# Altium schematic sheet pca10123-sheet3_misc.SchDoc: =BoardTitle
size A3; Organization: Nordic Semiconductor; DocumentNumber: 3; SheetNumber: 3; SheetTotal: 3; CompanyName: Nordic Semiconductor; DocumentSize: A3; Project Number: 4477
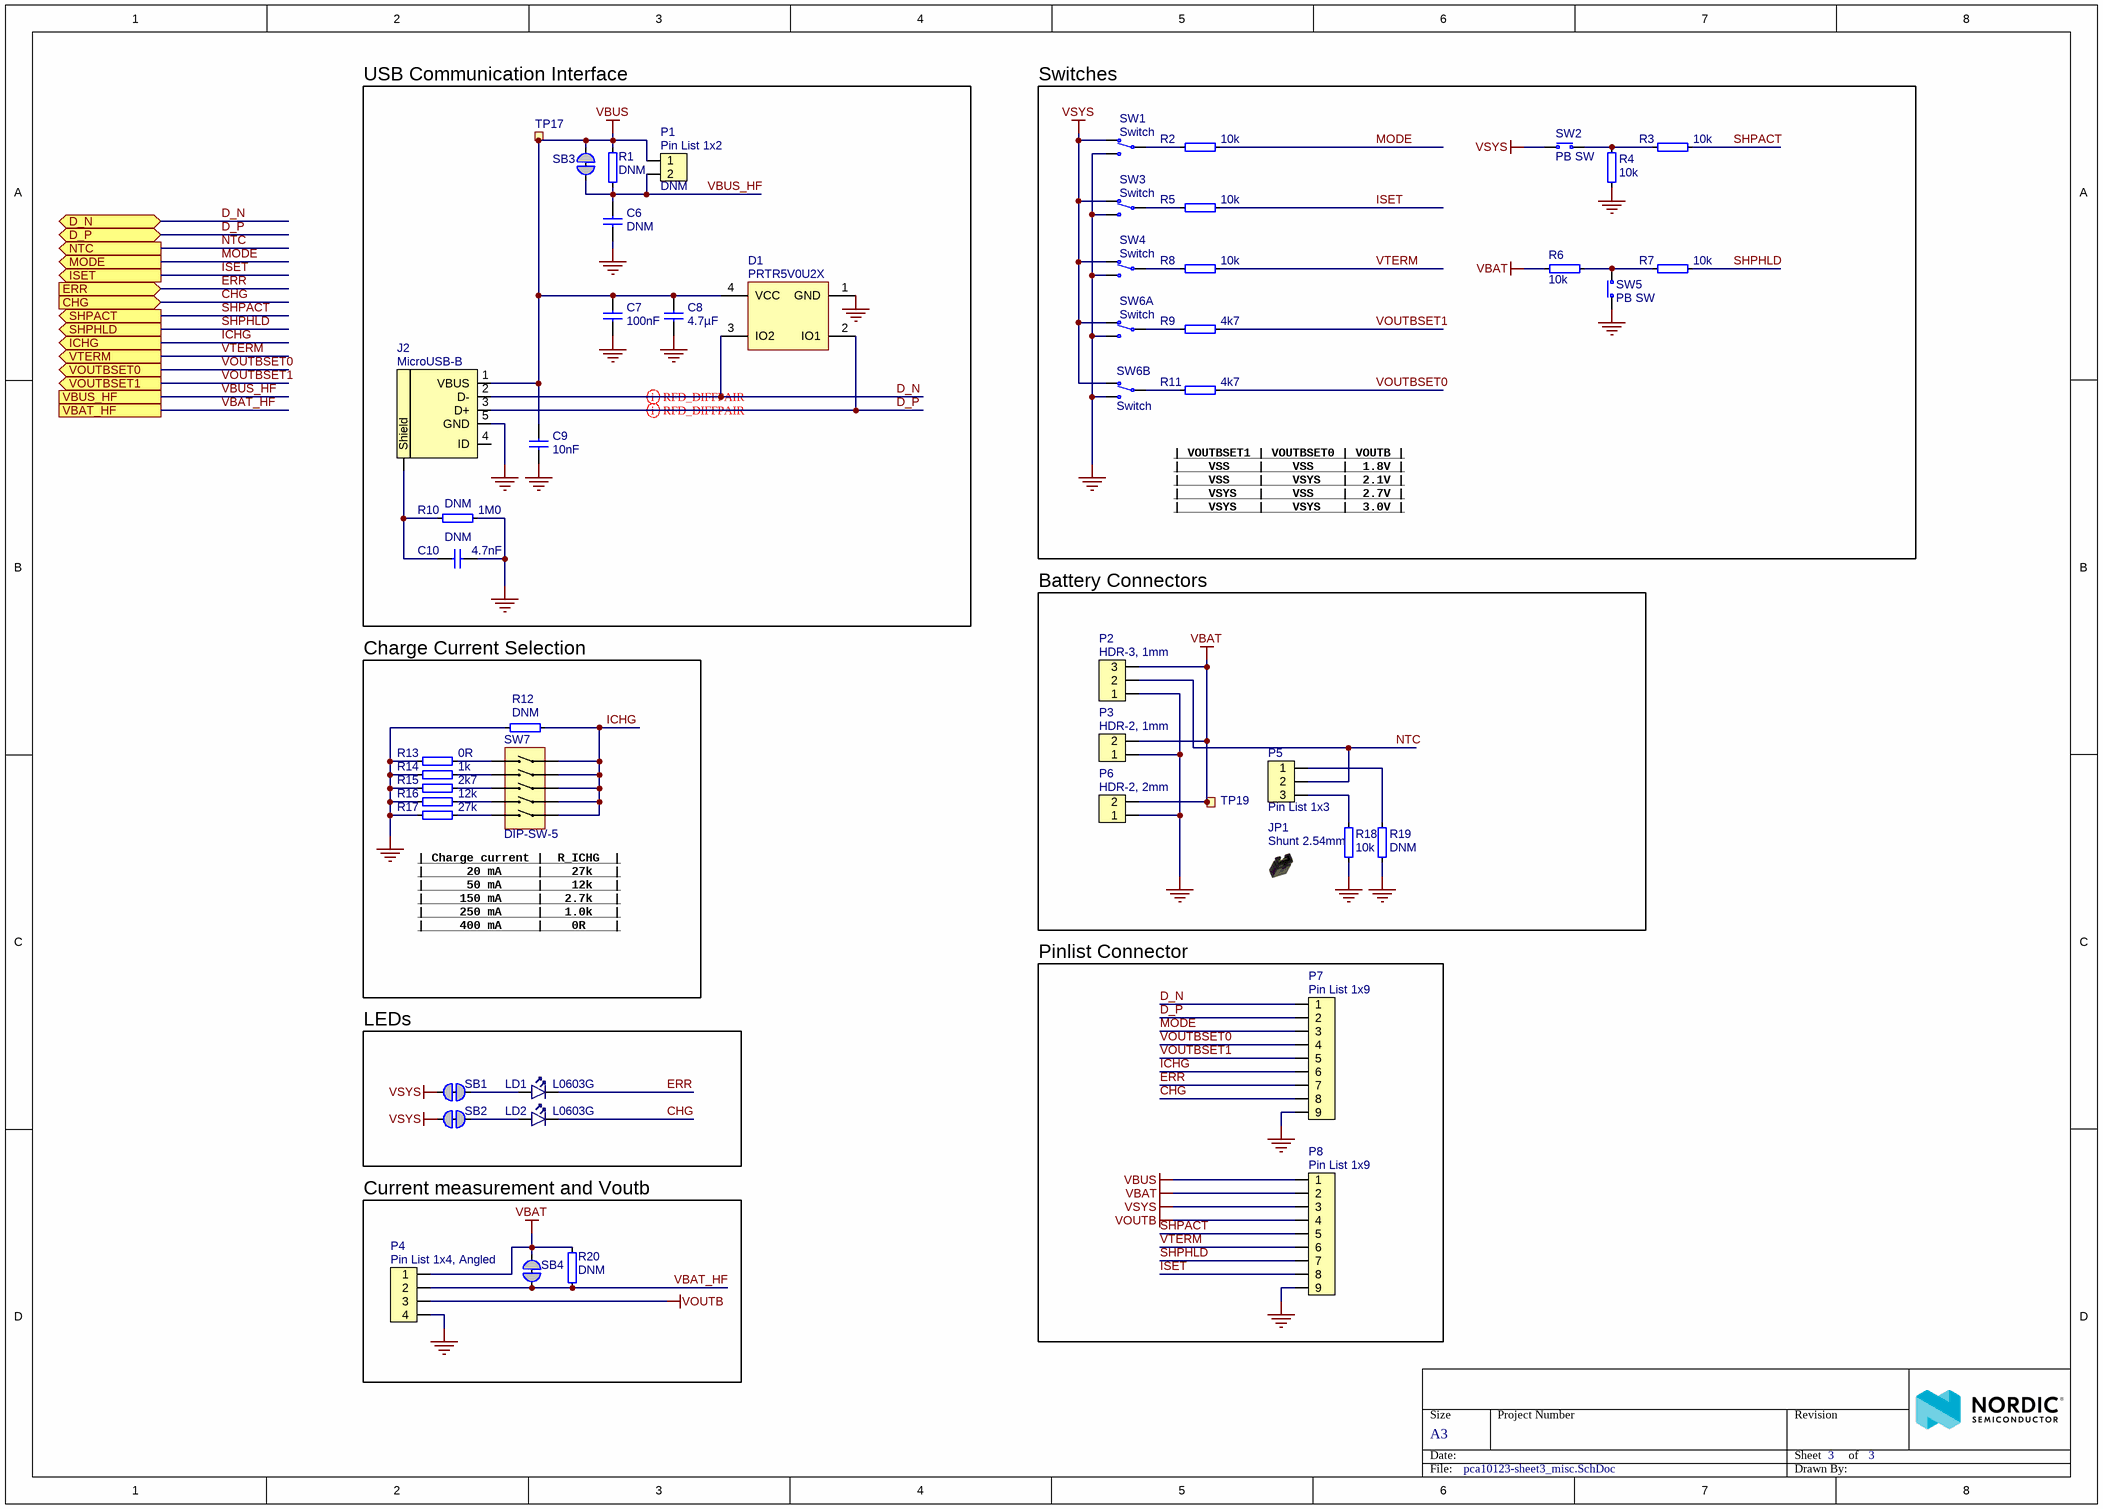
[diagram p0: pca10123-sheet3_misc.SchDoc]

## Parts
C6  DNM  [CAPC2012X11L_NC]
C7  100nF  [CAPC0603X03L_C]
C8  4.7µF  [CAPC1005X04L]
C9  10nF  [CAPC0603X03L_C]
C10  4.7nF  Assembly: DNM  [CAPC0603X03L_C]
D1  PRTR5V0U2X  [SOT190P230X110-4L]
J2  MicroUSB-B  [USB-Micro-B-RA-SMD-PiP]
JP1  Shunt 2.54mm  [Shunt_2.54mm]
LD1  L0603G  [LED_0603_R]
LD2  L0603G  [LED_0603_G]
P1  Pin List 1x2  Assembly: DNM  [LIST_1x2]
P2  HDR-3, 1mm  [SM03B-SRSS-TB]
P3  HDR-2, 1mm  [SM02B-SRSS-TB]
P4  Pin List 1x4, Angled  [LIST_ANG_1x4-SMD-2.54MM]
P5  Pin List 1x3  [LIST_1x3_SMD]
P6  HDR-2, 2mm  [S2B-PH-SM4-TB]
P7  Pin List 1x9  [LIST_1x9_SMD]
P8  Pin List 1x9  [LIST_1x9_SMD]
R1  DNM  [RESC1005X04L_NC]
R2  10k  [RESC1005X04L]
R3  10k  [RESC1005X04L]
R4  10k  [RESC1005X04L]
R5  10k  [RESC1005X04L]
R6  10k  [RESC1005X04L]
R7  10k  [RESC1005X04L]
R8  10k  [RESC1005X04L]
R9  4k7  [RESC1005X04L]
R10  1M0  Assembly: DNM  [RESC0603X03L_C]
R11  4k7  [RESC1005X04L]
R12  DNM  [RESC1005X04L_NC]
R13  0R  [RESC1005X04L]
R14  1k  [RESC1005X04L]
R15  2k7  [RESC1005X04L]
R16  12k  [RESC1005X04L]
R17  27k  [RESC1005X04L]
R18  10k  [RESC1005X04L]
R19  DNM  [RESC1608X06L_NC]
R20  DNM  [RESC1005X04L_NC]
SB1  Solderbridge  [Solderbridge_Shorted]  (value not drawn)  (net tie, no BOM)
SB2  Solderbridge  [Solderbridge_Shorted]  (value not drawn)  (net tie, no BOM)
SB3  Solderbridge  [Solderbridge_Shorted_Power]  (value not drawn)  (net tie, no BOM)
SB4  Solderbridge  [Solderbridge_Shorted_Power]  (value not drawn)  (net tie, no BOM)
SW1  Switch  [CJS-120xA]
SW2  PB SW  [C&K_PTS810]
SW3  Switch  [CJS-120xA]
SW4  Switch  [CJS-120xA]
SW5  PB SW  [C&K_PTS810]
SW6  Switch  [CAS-D20A]  (parts A,B of 2)
SW7  DIP-SW-5  [SOIC127P840X265-10N]
TP17  Ø1.5mm,SMD  [TP_SMD_D1.5mm]  (value not drawn)  (no BOM)
TP19  Ø1.5mm,SMD  [TP_SMD_D1.5mm]  (value not drawn)  (no BOM)

## Blocks framed on the sheet
USB Communication Interface: C6-C10 D1 J2 P1 R1 R10 SB3 TP17
Switches: R2-R9 R11 SW1-SW6
Battery Connectors: JP1 P2 P3 P5 P6 R18 R19 TP19
Charge Current Selection: R12-R17 SW7
Pinlist Connector: P7 P8
LEDs: LD1 LD2 SB1 SB2
Current measurement and Voutb: P4 R20 SB4

## Ports
CHG (in), D_N (bidir), D_P (bidir), ERR (in), ICHG (out), ISET (out), MODE (out), NTC (out), SHPACT (out), SHPHLD (out), VBAT_HF, VBUS_HF, VOUTBSET0 (out), VOUTBSET1 (out), VTERM (out)

## Nets
GND: C6.1 C7.2 C8.2 C9.2 C10.2 D1.1(GND) J2.5(GND) P2.1 P3.1 P4.4 P6.1 P7.9 P8.9 R4.2 R10.2 R12.1 R13.1 R14.1 R15.1 R16.1 R17.1 R18.1 R19.1 SW1.3(N.O) SW3.3(N.O) SW4.3(N.O) SW5.2(COM) SW6.1(N.O) SW6.4(N.O)
VBAT: P2.3 P3.2 P4.1 P6.2 P8.2 R6.2 R20.2 SB4.2 TP19.1
VBUS: C7.1 C8.1 C9.1 D1.4(VCC) J2.1(VBUS) P1.1 P8.1 R1.2 SB3.1 TP17.1
VOUTB: P4.3 P8.4
VSYS: P8.3 SB1.1 SB2.1 SW1.1(N.C) SW2.2(COM) SW3.1(N.C) SW4.1(N.C) SW6.3(N.C) SW6.6(N.C)
CHG: LD2.1(C) P7.8 ; port CHG
D_N: D1.3(IO2) J2.2(D-) P7.1 ; port D_N
D_P: D1.2(IO1) J2.3(D+) P7.2 ; port D_P
ERR: LD1.1(C) P7.7 ; port ERR
ICHG: P7.6 R12.2 SW7.6 SW7.7 SW7.8 SW7.9 SW7.10 ; port ICHG
ISET: P8.8 R5.2 ; port ISET
MODE: P7.3 R2.2 ; port MODE
NTC: P2.2 P5.2 ; port NTC
SHPACT: P8.5 R3.2 ; port SHPACT
SHPHLD: P8.7 R7.2 ; port SHPHLD
VBAT_HF: P4.2 R20.1 SB4.1 ; port VBAT_HF
VBUS_HF: C6.2 P1.2 R1.1 SB3.2 ; port VBUS_HF
VOUTBSET0: P7.4 R11.2 ; port VOUTBSET0
VOUTBSET1: P7.5 R9.2 ; port VOUTBSET1
VTERM: P8.6 R8.2 ; port VTERM
NetC10_1: C10.1 J2.6(Shield) R10.1
NetLD1_2: LD1.2(A) SB1.2
NetLD2_2: LD2.2(A) SB2.2
NetP5_1: P5.1 R19.2
NetP5_3: P5.3 R18.2
NetR2_1: R2.1 SW1.2(COM)
NetR3_1: R3.1 R4.1 SW2.1(N.O)
NetR5_1: R5.1 SW3.2(COM)
NetR6_1: R6.1 R7.1 SW5.1(N.O)
NetR8_1: R8.1 SW4.2(COM)
NetR9_1: R9.1 SW6.2(COM)
NetR11_1: R11.1 SW6.5(COM)
NetR13_2: R13.2 SW7.1
NetR14_2: R14.2 SW7.2
NetR15_2: R15.2 SW7.3
NetR16_2: R16.2 SW7.4
NetR17_2: R17.2 SW7.5

Not connected (* = marked no-connect by the designer): J2 4(ID)

## Layout directives
differential pair; differential pair class USB2: D_N, D_P

## Notes on the sheet
- | VOUTBSET1 | VOUTBSET0 | VOUTB |
  |    VSS    |    VSS    |  1.8V |
  |    VSS    |    VSYS   |  2.1V |
  |    VSYS   |    VSS    |  2.7V |
  |    VSYS   |    VSYS   |  3.0V |
- | Charge current |  R_ICHG  |
  |      20 mA     |    27k   |
  |      50 mA     |    12k   |
  |     150 mA     |   2.7k   |
  |     250 mA     |   1.0k   |
  |     400 mA     |    0R    |
- Size
- Date:
- A3
- Project Number
- Sheet         of
- Revision
- File:
- Drawn By:

## Library data of the parts
C6 = C0805-N.C.: Not mounted; Manufacturer: N.A.; Assembly: Not mounted; Note: Chip Cap; Pad Count: 2; Part Number: C0805-N.C.; Manufacturer Part Number: N.A.; ComponentLink1URL: N.A.; ComponentLink1Description: Datasheet; ComponentLink2URL: N.A.; ComponentLink2Description: Supplier link; HelpURL: N.A.; Footprint Doc: 0805; LatestRevisionDate: 2013-06-04; Publisher: Nordic Semiconductor; Published: 2009-05-08; Value: DNM; Supplier 1: N.A.; Supplier Part Number 1: N.A.; Supplier 2: N.A.; Supplier Part Number 2: N.A.; Artikkelnr Noca: N.A.; Part number IPS: N.A.; Component Class: Capacitors; PartId: 100200278; Author: rsk; Part number Norautron: N.A.
C7 = C0201-100n: Capacitor, X5R, ±10%; Manufacturer: N.A.; Part number IPS: 00000001248, 00000002505; Note: 16V; Pad Count: 2; Part Number: C0201-100n; Manufacturer Part Number: N.A.; ComponentLink1URL: N.A.; ComponentLink1Description: Datasheet; ComponentLink2URL: N.A.; ComponentLink2Description: Supplier link; HelpURL: N.A.; Footprint Doc: 0201; LatestRevisionDate: 2017-11-09; Publisher: Nordic Semiconductor; Published: 2014-11-13; Value: 100nF; Supplier 1: N.A.; Supplier Part Number 1: N.A.; Supplier 2: N.A.; Supplier Part Number 2: N.A.; Artikkelnr Noca: N.A.; Component Class: Capacitors; PartId: 100200078; Author: rsk; Part number Norautron: N.A.
C8 = C0402-4µ7: Capacitor, X5R, ±20%; Manufacturer: N.A.; Part number IPS: 00000001251, 00000007165; Note: 10V; Artikkelnr Noca: 20039482; Pad Count: 2; Part Number: C0402-4µ7; Manufacturer Part Number: N.A.; LatestRevisionDate: 2017-11-09; Publisher: Nordic Semiconductor; Published: 2009-05-08; Value: 4.7µF; Footprint Doc: 0402; ComponentLink1URL: N.A.; ComponentLink1Description: Datasheet; ComponentLink2URL: N.A.; ComponentLink2Description: Supplier link; HelpURL: N.A.; Supplier 1: Digi-Key; Supplier Part Number 1: 490-13252-1-ND; Supplier 2: N.A.; Supplier Part Number 2: N.A.; Component Class: Capacitors; PartId: 100200193; Author: rsk; Part number Norautron: N.A.
C9 = C0201-10n: Capacitor, X7R, ±10%; Manufacturer: N.A.; Part number IPS: 00000003480; Note: 10V; Pad Count: 2; Part Number: C0201-10n; Manufacturer Part Number: N.A.; LatestRevisionDate: 2017-11-09; Publisher: Nordic Semiconductor; Published: 2014-11-13; Value: 10nF; Artikkelnr Noca: N.A.; ComponentLink1URL: N.A.; ComponentLink1Description: Datasheet; ComponentLink2URL: N.A.; ComponentLink2Description: Supplier link; HelpURL: N.A.; Footprint Doc: 0201; Supplier 1: N.A.; Supplier Part Number 1: N.A.; Supplier 2: N.A.; Supplier Part Number 2: N.A.; Component Class: Capacitors; PartId: 100200067; Author: rsk; Part number Norautron: N.A.
C10 = C0201-4n7: Chip Cap 0201 4.7nF 10% 10V X7R; Manufacturer: N.A.; Part number IPS: 00000001243; Note: Chip Cap 1%; Pad Count: 2; Part Number: C0201-4n7; Manufacturer Part Number: N.A.; LatestRevisionDate: 2020-10-13; Publisher: Nordic Semiconductor; Published: 2014-11-13; Value: 4.7nF; Artikkelnr Noca: N.A.; Footprint Doc: 0201; ComponentLink1URL: N.A.; ComponentLink1Description: Datasheet; ComponentLink2URL: N.A.; ComponentLink2Description: Supplier link; HelpURL: N.A.; Supplier 1: N.A.; Supplier Part Number 1: N.A.; Supplier 2: N.A.; Supplier Part Number 2: N.A.; Component Class: Capacitors; PartId: 100200063; Author: rsk; Part number Norautron: N.A.
D1 = PRTR5V0U2X: Ultra low capacitance double rail-to-rail ESD protection diode; Manufacturer: NXP Semiconductors; Part number IPS: 00000009951; Note: N.A.; Artikkelnr Noca: 10069015; Pad Count: 4; Part Number: PRTR5V0U2X; Manufacturer Part Number: PRTR5V0U2X; LatestRevisionDate: 2017-11-09; Publisher: Nordic Semiconductor; Published: 2012-06-11; Value: PRTR5V0U2X; Footprint Doc: SOT-143B; ComponentLink1URL: N.A.; ComponentLink1Description: Datasheet; ComponentLink2URL: N.A.; ComponentLink2Description: Supplier link; HelpURL: http://www.farnell.com/datasheets/109718.pdf; Supplier 1: Digi-Key; Supplier Part Number 1: 568-4140-1-ND; Supplier 2: Farnell; Supplier Part Number 2: 152-4157; Component Class: Semiconductors; PartId: 101300082; Author: rsk; Part number Norautron: N.A.
J2 = USB-Micro-B-RA-SMD-PiP: MicroUSB-B-SMT; Manufacturer: Allen Creations Corp.; Manufacturer Part Number: AJU55-BS2111-L; Part number IPS: 00000007790; Note: N.A.; Artikkelnr Noca: 55029020; Pad Count: 5; Part Number: USB-Micro-B-RA-SMD-PiP; Footprint Doc: USB-Micro-B-RA-SMD-PiP; LatestRevisionDate: 2016-04-21; Pin Count: 5; Publisher: Nordic Semiconductor; Published: 2014-10-07; Value: MicroUSB-B; ComponentLink1URL: N.A.; ComponentLink1Description: Datasheet; ComponentLink2URL: N.A.; ComponentLink2Description: Supplier link; HelpURL: \\hizz\pro\app9717\Datasheet\connectors\Allen Creations Corp\AJU-211.pdf; Supplier 1: Cabcon; Supplier Part Number 1: AJU55-BS2111-L; Supplier 2: Digi-Key; Supplier Part Number 2: 609-4616-1-ND; Component Class: Connectors; PartId: 100500490; Author: rsk; Part number Norautron: N.A.
JP1 = SHUNT JUMPER 2.54mm BLACK GOLD: SHUNT JUMPER .1" BLACK GOLD; Manufacturer: 3M; Manufacturer Part Number: 969102-0000-DA; Part number IPS: N.A.; Note: SHUNT JUMPER .1" BLACK GOLD, h=6.00mm, w=5.00mm; Artikkelnr Noca: 56099001; Pad Count: 2; Part Number: SHUNT JUMPER 2.54mm BLACK GOLD; ComponentLink1URL: N.A.; ComponentLink1Description: Datasheet; ComponentLink2URL: N.A.; ComponentLink2Description: Supplier link; HelpURL: http://www.digikey.com/product-detail/en/969102-0000-DA; Footprint Doc: SHUNT JUMPER 2.54mm; LatestRevisionDate: 2012-07-06; Published: 2012-07-06; Value: Shunt 2.54mm; Supplier 1: Digi-Key; Supplier Part Number 1: 3M9580-ND; Supplier 2: Cabcon; Supplier Part Number 2: 3710-6001OSOB01; Component Class: Connectors; PartId: 100500392; Author: rsk; Part number Norautron: N.A.
LD1 = ASMT-RR45-AQ902: LED, Red, 0603, Vf=2V, - 40 to +100°C; Manufacturer: Avago; Note: 90 mcd @ 20 mA; Artikkelnr Noca: N.A.; Pad Count: 2; Part Number: ASMT-RR45-AQ902; Manufacturer Part Number: ASMT-RR45-AQ902; ComponentLink1URL: N.A.; ComponentLink1Description: Datasheet; ComponentLink2URL: N.A.; ComponentLink2Description: Supplier link; HelpURL: http://www.avagotech.com/docs/AV02-0378EN; Footprint Doc: 0603; LatestRevisionDate: 2015-06-12; Publisher: Nordic Semiconductor; Published: 2015-06-12; Value: L0603G; Supplier 1: Digi-Key; Supplier Part Number 1: 516-2005-1-ND; Supplier 2: Mouser; Supplier Part Number 2: 630-ASMT-RR45-AQ902; Part number IPS: N.A.; Component Class: Optoelectronics; PartId: 101400008; Author: rsk; Part number Norautron: N.A.
LD2 = ASMT-RF45-AN002: LED, Yellow Green, 0603, Vf=2V, - 40 to +100°C; Manufacturer: Avago; Note: 28 mcd @ 20 mA; Artikkelnr Noca: N.A.; Pad Count: 2; Part Number: ASMT-RF45-AN002; Manufacturer Part Number: ASMT-RF45-AN002; ComponentLink1URL: N.A.; ComponentLink1Description: Datasheet; ComponentLink2URL: N.A.; ComponentLink2Description: Supplier link; HelpURL: http://www.avagotech.com/docs/AV02-0378EN; Footprint Doc: 0603; LatestRevisionDate: 2015-06-12; Publisher: Nordic Semiconductor; Published: 2015-06-12; Value: L0603G; Supplier 1: Digi-Key; Supplier Part Number 1: 516-2522-1-ND; Supplier 2: Mouser; Supplier Part Number 2: 630-ASMT-RF45-AN002; Part number IPS: N.A.; Component Class: Optoelectronics; PartId: 101400010; Author: rsk; Part number Norautron: N.A.
P1 = Pin List 1x2: Pin List 1x2, 2.54mm (100mil); Manufacturer: N.A.; Pad Count: 2; Artikkelnr Noca: 56019040; Part Number: Pin List 1x2; Component Class: Connectors; Manufacturer Part Number: N.A.; ComponentLink1URL: N.A.; ComponentLink1Description: Datasheet; ComponentLink2URL: N.A.; ComponentLink2Description: Supplier link; HelpURL: N.A.; Footprint Doc: LIST_1x2; LatestRevisionDate: 2009-12-12; Publisher: Nordic Semiconductor; Published: 2009-12-12; Value: Pin List 1x2; Note: N.A.; Supplier 1: N.A.; Supplier Part Number 1: N.A.; Supplier 2: N.A.; Supplier Part Number 2: N.A.; Part number IPS: N.A.; PartId: 100500297; Author: rsk; Part number Norautron: N.A.
P2 = SM03B-SRSS-TB: 1.0mm pitch connector side entry SMD; Manufacturer: JST Sales America Inc.; Manufacturer Part Number: SM03B-SRSS-TB(LF)(SN); Part number IPS: 00000001785; Note: JST, Header; Artikkelnr Noca: N.A.; Pad Count: 3; Part Number: SM03B-SRSS-TB; ComponentLink1URL: N.A.; ComponentLink1Description: Datasheet; ComponentLink2URL: N.A.; ComponentLink2Description: Supplier link; HelpURL: http://www.jst-mfg.com/product/pdf/eng/eSH.pdf; Footprint Doc: SM03B-SRSS-TB; LatestRevisionDate: 2017-10-09; Pin Count: 3; Publisher: Nordic Semiconductor; Published: 2017-10-09; Value: HDR-3, 1mm; Supplier 1: Cabcon; Supplier Part Number 1: SM03B-SRSS-TB(LF)(SN); Supplier 2: Digi-Key; Supplier Part Number 2: 455-1803-1-ND; Component Class: Connectors; PartId: 100500605; Author: rsk; Part number Norautron: N.A.
P3 = SM02B-SRSS-TB: 1.0mm pitch connector side entry SMD; Manufacturer: JST Sales America Inc.; Manufacturer Part Number: SM02B-SRSS-TB(LF)(SN); Part number IPS: 00000007791; Part number Norautron: N.A.; Note: JST, Header; Artikkelnr Noca: 55010030; Pad Count: 2; Part Number: SM02B-SRSS-TB; ComponentLink1URL: N.A.; ComponentLink1Description: Datasheet; ComponentLink2URL: N.A.; ComponentLink2Description: Supplier link; HelpURL: http://www.jst-mfg.com/product/pdf/eng/eSH.pdf; Footprint Doc: SM02B-SRSS-TB; LatestRevisionDate: 2016-06-20; Pin Count: 2; Publisher: Nordic Semiconductor; Published: 2016-06-20; Value: HDR-2, 1mm; Supplier 1: Cabcon; Supplier Part Number 1: SM02B-SRSS-TB(LF)(SN); Supplier 2: Digi-Key; Supplier Part Number 2: 455-1802-1-ND; Component Class: Connectors; PartId: 100500383; Author: rsk
P4 = Pin List Ang 1x4 SMD, 2.54mm: Pin List 1x4, 2.54mm (100mil), Right Angled, SMD; Manufacturer: W-CON; Manufacturer Part Number: 1125B-1104S0Z135CR02; Part number IPS: 00000004780; Pad Count: 4; Note: N.A.; Part Number: Pin List Ang 1x4 SMD, 2.54mm; PartId: 100500358; Component Class: Connectors; ComponentLink1URL: N.A.; ComponentLink1Description: Datasheet; ComponentLink2URL: N.A.; ComponentLink2Description: Supplier link; HelpURL: N.A.; Footprint Doc: LIST_ANG_1x4-SMD-2.54MM; LatestRevisionDate: 2020-04-29; Published: 2015-01-23; Value: Pin List 1x4, Angled; Supplier 1: Cabcon; Supplier Part Number 1: 1125B-1104S0Z135CR02; Supplier 2: Samtec; Supplier Part Number 2: TSM-104-01-L-SH-A; Artikkelnr Noca: N.A.; Author: rsk; Part number Norautron: N.A.
P5 = Pin List 1x3 SMD: Pin List 1x3, 2.54mm (100mil), SMD; Manufacturer: W-CON; Manufacturer Part Number: 1125-1103S3M116CR02; Note: N.A.; Pad Count: 3; Part Number: Pin List 1x3 SMD; ComponentLink1URL: N.A.; ComponentLink1Description: Datasheet; ComponentLink2URL: N.A.; ComponentLink2Description: Supplier link; HelpURL: N.A.; Footprint Doc: LIST_1x3_SMD; LatestRevisionDate: 2021-06-16; Pin Count: 3; Publisher: Nordic Semiconductor; Published: 2013-10-21; Value: Pin List 1x3; Supplier 1: W-CON; Supplier Part Number 1: 1125-1103S3M116CR02; Supplier 2: Samtec; Supplier Part Number 2: TSM-103-01-L-SV-P-TR; Artikkelnr Noca: N.A.; Part number IPS: N.A.; Component Class: Connectors; PartId: 100500306; Author: rsk; Part number Norautron: N.A.
P6 = S2B-PH-SM4-TB: 2.0mm pitch connector side entry SMD; Manufacturer: JST Sales America Inc.; Manufacturer Part Number: S2B-PH-SM4-TB(LF)(SN); Note: JST, Header; Artikkelnr Noca: N.A.; Pad Count: 2; Part Number: S2B-PH-SM4-TB; ComponentLink1URL: http://www.jst-mfg.com/product/pdf/eng/ePH.pdf; ComponentLink1Description: Datasheet; ComponentLink2URL: N.A.; ComponentLink2Description: Supplier link; HelpURL: http://www.jst-mfg.com/product/pdf/eng/ePH.pdf; Footprint Doc: S2B-PH-SM4-TB; LatestRevisionDate: 2015-12-22; Pin Count: 2; Publisher: Nordic Semiconductor; Published: 2015-12-22; Value: HDR-2, 2mm; Supplier 1: Cabcon; Supplier Part Number 1: S2B-PH-SM4-TB(LF)(SN); Supplier 2: Digi-Key; Supplier Part Number 2: 455-1749-1-ND; Part number IPS: N.A.; Component Class: Connectors; PartId: 100500381; Author: rsk; Part number Norautron: N.A.
P7 P8 = Pin List 1x9 SMD: Pin List 1x9, 2.54mm (100mil), SMD; Manufacturer: W-CON; Manufacturer Part Number: 1125-1109S0M116R2; Note: N.A.; Artikkelnr Noca: 55010024; Pad Count: 9; Part Number: Pin List 1x9 SMD; ComponentLink1URL: N.A.; ComponentLink1Description: Datasheet; ComponentLink2URL: N.A.; ComponentLink2Description: Supplier link; HelpURL: \\hizz\pro\app9717\Datasheet\connectors\W-CON\1125-11XXXXMXXXXX.pdf; Footprint Doc: LIST_1x9_SMD; LatestRevisionDate: 2016-06-02; Published: 2016-03-29; Value: Pin List 1x9; Supplier 1: Cabcon; Supplier Part Number 1: 1125-1109S0M116R2; Supplier 2: Samtec; Supplier Part Number 2: TSM-109-01-L-SV-P-TR; Part number IPS: N.A.; Component Class: Connectors; PartId: 100500333; Author: rsk; Part number Norautron: N.A.
R1 R12 R20 = R0402-N.C.: Not mounted; Manufacturer: N.A.; Assembly: Not mounted; Note: Chip Res; Pad Count: 2; Part Number: R0402-N.C.; Manufacturer Part Number: N.A.; ComponentLink1URL: N.A.; ComponentLink1Description: Datasheet; ComponentLink2URL: N.A.; ComponentLink2Description: Supplier link; HelpURL: N.A.; Footprint Doc: 0402; LatestRevisionDate: 2009-05-08; Published: 2009-05-08; Value: DNM; Supplier 1: N.A.; Supplier Part Number 1: N.A.; Supplier 2: N.A.; Supplier Part Number 2: N.A.; Artikkelnr Noca: N.A.; Part number IPS: N.A.; Component Class: Resistors; PartId: 100100281; Author: rsk; Part number Norautron: N.A.
  R1 R12: Publisher: Nordic Semiconductor
R2-R8 R18 = R0402-10k: Resistor, ±1%, 0.063W; Manufacturer: N.A.; Part number IPS: 00000002093; Note: Chip Res 1%; Artikkelnr Noca: 27049097; Pad Count: 2; Part Number: R0402-10k; Manufacturer Part Number: N.A.; ComponentLink1URL: N.A.; ComponentLink1Description: Datasheet; ComponentLink2URL: N.A.; ComponentLink2Description: Supplier link; HelpURL: N.A.; Footprint Doc: 0402; LatestRevisionDate: 2009-11-23; Publisher: Nordic Semiconductor; Published: 2009-05-08; Value: 10k; Supplier 1: Farnell; Supplier Part Number 1: 173-8864; Supplier 2: N.A.; Supplier Part Number 2: N.A.; Component Class: Resistors; PartId: 100100198; Author: rsk; Part number Norautron: N.A.
R9 R11 = R0402-4K7: Resistor, ±1%, 0.063W; Manufacturer: N.A.; Part number IPS: 00000003433; Note: Chip Res 1%; Artikkelnr Noca: 27049089; Pad Count: 2; Part Number: R0402-4k7; Manufacturer Part Number: N.A.; ComponentLink1URL: N.A.; ComponentLink1Description: Datasheet; ComponentLink2URL: N.A.; ComponentLink2Description: Supplier link; HelpURL: N.A.; Footprint Doc: 0402; LatestRevisionDate: 2009-11-23; Publisher: Nordic Semiconductor; Published: 2009-05-08; Value: 4k7; Supplier 1: Farnell; Supplier Part Number 1: 173-8858; Supplier 2: N.A.; Supplier Part Number 2: N.A.; Component Class: Resistors; PartId: 100100190; Author: rsk; Part number Norautron: N.A.
R10 = R0201-1M0: Resistor, ±1%, 0.05W; Manufacturer: N.A.; Part number IPS: 00000001418; Note: Chip Res 1%; Pad Count: 2; Value: 1M0; Part Number: R0201-1M0; Manufacturer Part Number: N.A.; LatestRevisionDate: 2014-11-13; Publisher: Nordic Semiconductor; Published: 2014-11-13; Artikkelnr Noca: N.A.; Footprint Doc: 0201; ComponentLink1URL: N.A.; ComponentLink1Description: Datasheet; ComponentLink2URL: N.A.; ComponentLink2Description: Supplier link; HelpURL: N.A.; Supplier 1: N.A.; Supplier Part Number 1: N.A.; Supplier 2: N.A.; Supplier Part Number 2: N.A.; Component Class: Resistors; PartId: 100100093; Author: rsk; Part number Norautron: N.A.
R13 = R0402-0R: Resistor, ±5%, 0.063W; Manufacturer: N.A.; Part number IPS: 00000007128; Note: Chip Res 5%; Artikkelnr Noca: 27049000; Pad Count: 2; Part Number: R0402-0R; Manufacturer Part Number: N.A.; ComponentLink1URL: N.A.; ComponentLink1Description: Datasheet; ComponentLink2URL: N.A.; ComponentLink2Description: Supplier link; HelpURL: N.A.; Footprint Doc: 0402; LatestRevisionDate: 2009-11-23; Publisher: Nordic Semiconductor; Published: 2009-05-08; Value: 0R; Supplier 1: Farnell; Supplier Part Number 1: 146-9661; Supplier 2: N.A.; Supplier Part Number 2: N.A.; Component Class: Resistors; PartId: 100100109; Author: rsk; Part number Norautron: N.A.
R14 = R0402-1k0: Resistor, ±1%, 0.063W; Manufacturer: N.A.; Part number IPS: 00000002218; Note: Chip Res 1%; Artikkelnr Noca: 27049073; Pad Count: 2; Part Number: R0402-1k0; Manufacturer Part Number: N.A.; ComponentLink1URL: N.A.; ComponentLink1Description: Datasheet; ComponentLink2URL: N.A.; ComponentLink2Description: Supplier link; HelpURL: N.A.; Footprint Doc: 0402; LatestRevisionDate: 2009-11-23; Publisher: Nordic Semiconductor; Published: 2009-05-08; Value: 1k; Supplier 1: Farnell; Supplier Part Number 1: 173-8850; Supplier 2: N.A.; Supplier Part Number 2: N.A.; Component Class: Resistors; PartId: 100100171; Author: rsk; Part number Norautron: N.A.
R15 = R0402-2k7: Resistor, ±1%, 0.063W; Manufacturer: N.A.; Note: Chip Res 1%; Artikkelnr Noca: 27049083; Pad Count: 2; Part Number: R0402-2k7; Manufacturer Part Number: N.A.; ComponentLink1URL: N.A.; ComponentLink1Description: Datasheet; ComponentLink2URL: N.A.; ComponentLink2Description: Supplier link; HelpURL: N.A.; Footprint Doc: 0402; LatestRevisionDate: 2009-11-23; Publisher: Nordic Semiconductor; Published: 2009-05-08; Value: 2k7; Supplier 1: Farnell; Supplier Part Number 1: 173-8855; Supplier 2: N.A.; Supplier Part Number 2: N.A.; Part number IPS: N.A.; Component Class: Resistors; PartId: 100100184; Author: rsk; Part number Norautron: N.A.
R16 = R0402-12k: Resistor, ±1%, 0.063W; Manufacturer: N.A.; Note: Chip Res 1%; Artikkelnr Noca: 27049099; Pad Count: 2; Part Number: R0402-12k; Manufacturer Part Number: N.A.; ComponentLink1URL: N.A.; ComponentLink1Description: Datasheet; ComponentLink2URL: N.A.; ComponentLink2Description: Supplier link; HelpURL: N.A.; Footprint Doc: 0402; LatestRevisionDate: 2009-11-23; Publisher: Nordic Semiconductor; Published: 2009-05-08; Value: 12k; Supplier 1: Farnell; Supplier Part Number 1: 173-8865; Supplier 2: N.A.; Supplier Part Number 2: N.A.; Part number IPS: N.A.; Component Class: Resistors; PartId: 100100201; Author: rsk; Part number Norautron: N.A.
R17 = R0402-27k: Resistor, ±1%, 0.063W; Manufacturer: N.A.; Part number IPS: 00000004188; Note: Chip Res 1%; Artikkelnr Noca: 27049107; Pad Count: 2; Part Number: R0402-27k; Manufacturer Part Number: N.A.; ComponentLink1URL: N.A.; ComponentLink1Description: Datasheet; ComponentLink2URL: N.A.; ComponentLink2Description: Supplier link; HelpURL: N.A.; Footprint Doc: 0402; LatestRevisionDate: 2009-11-23; Publisher: Nordic Semiconductor; Published: 2009-05-08; Value: 27k; Supplier 1: Farnell; Supplier Part Number 1: 173-8869; Supplier 2: N.A.; Supplier Part Number 2: N.A.; Component Class: Resistors; PartId: 100100215; Author: rsk; Part number Norautron: N.A.
R19 = R0603-N.C.: Not mounted; Manufacturer: N.A.; Assembly: Not mounted; Note: Chip Res; Pad Count: 2; Part Number: R0603-N.C.; Manufacturer Part Number: N.A.; ComponentLink1URL: N.A.; ComponentLink1Description: Datasheet; ComponentLink2URL: N.A.; ComponentLink2Description: Supplier link; HelpURL: N.A.; Footprint Doc: 0603; LatestRevisionDate: 2010-09-07; Publisher: Nordic Semiconductor; Published: 2010-09-07; Value: DNM; Supplier 1: N.A.; Supplier Part Number 1: N.A.; Supplier 2: N.A.; Supplier Part Number 2: N.A.; Artikkelnr Noca: N.A.; Part number IPS: N.A.; Component Class: Resistors; PartId: 100100373; Author: rsk; Part number Norautron: N.A.
SB1 SB2 = Solderbridge Shorted: Shorted Solderbridge; Manufacturer: N.A.; Pad Count: 2; Part Number: Solderbridge Shorted; Manufacturer Part Number: N.A.; ComponentLink1URL: N.A.; ComponentLink1Description: Datasheet; ComponentLink2URL: N.A.; ComponentLink2Description: Supplier link; HelpURL: N.A.; Footprint Doc: Solderbridge_Shorted; LatestRevisionDate: 2012-08-07; Pin Count: 2; Publisher: Nordic Semiconductor; Published: 2012-08-07; Value: Solderbridge; Note: N.A.; Supplier 1: N.A.; Supplier Part Number 1: N.A.; Supplier 2: N.A.; Supplier Part Number 2: N.A.; Artikkelnr Noca: N.A.; Part number IPS: N.A.; Component Class: Connectors; PartId: 100500459; Author: rsk; Part number Norautron: N.A.
SB3 SB4 = Solderbridge Shorted Power: Shorted Solderbridge Power; Manufacturer: N.A.; Pad Count: 2; Part Number: Solderbridge Shorted Power; Manufacturer Part Number: N.A.; ComponentLink1URL: N.A.; ComponentLink1Description: Datasheet; ComponentLink2URL: N.A.; ComponentLink2Description: Supplier link; HelpURL: N.A.; Footprint Doc: Solderbridge_Shorted_Power; LatestRevisionDate: 2012-08-07; Pin Count: 2; Publisher: Nordic Semiconductor; Published: 2012-08-07; Value: Solderbridge; Note: N.A.; Supplier 1: N.A.; Supplier Part Number 1: N.A.; Supplier 2: N.A.; Supplier Part Number 2: N.A.; Artikkelnr Noca: N.A.; Part number IPS: N.A.; Component Class: Connectors; PartId: 100500460; Author: rsk; Part number Norautron: N.A.
SW1 SW3 SW4 = CJS-1200TA: SMD slide Switch (ON-ON); Manufacturer: Copal Electronics Inc; Part number IPS: 00000009982; Note: N.A.; Artikkelnr Noca: 50019068; Pad Count: 3; Part Number: CJS-1200TA; Manufacturer Part Number: CJS-1200TA; ComponentLink1URL: N.A.; ComponentLink1Description: Datasheet; ComponentLink2URL: N.A.; ComponentLink2Description: Supplier link; HelpURL: http://media.digikey.com/pdf/Data%20Sheets/COPAL%20Electronics%20PDFs/CJS.pdf; Footprint Doc: CJS-120xA; LatestRevisionDate: 2012-10-03; Publisher: Nordic Semiconductor; Published: 2012-10-03; Value: Switch; Supplier 1: Digi-Key; Supplier Part Number 1: 563-1021-2-ND; Supplier 2: N.A.; Supplier Part Number 2: N.A.; Component Class: Switches; PartId: 101500005; Author: rsk; Part number Norautron: N.A.
SW2 SW5 = PTS810 SJK 250 SMTR LFS: Tactile Switch, SPNO, SMD, 260gf, 4.2x3.2x2.5mm; Manufacturer: C&K; Part number IPS: 00000001259; Note: N.A.; Pad Count: 4; Part Number: PTS810 SJK 250 SMTR LFS; Manufacturer Part Number: PTS810 SJK 250 SMTR LFS; ComponentLink1URL: N.A.; ComponentLink1Description: Datasheet; ComponentLink2URL: N.A.; ComponentLink2Description: Supplier link; HelpURL: http://www.ckswitches.com/media/1476/pts810.pdf; Footprint Doc: PTS810; LatestRevisionDate: 2017-11-09; Publisher: Nordic Semiconductor; Published: 2017-09-18; Value: PB SW; Supplier 1: Digi-Key; Supplier Part Number 1: CKN10503TR-ND; Supplier 2: N.A.; Supplier Part Number 2: N.A.; Artikkelnr Noca: N.A.; Component Class: Switches; PartId: 101500104; Author: rsk; Part number Norautron: N.A.
SW6 = CAS-D20TA: SMD slide Switch 2xSPDT; Manufacturer: Copal Electronics Inc; Note: N.A.; Pad Count: 6; Part Number: CAS-D20TA; Manufacturer Part Number: CAS-D20TA; ComponentLink1URL: N.A.; ComponentLink1Description: Datasheet; ComponentLink2URL: N.A.; ComponentLink2Description: Supplier link; HelpURL: http://copal-electronics.info/jp/0019b/cas_ja.pdf; Footprint Doc: CAS-D20A; LatestRevisionDate: 2012-10-08; Publisher: Nordic Semiconductor; Published: 2012-10-08; Value: Switch; Supplier 1: Digi-Key; Supplier Part Number 1: CASD20JTR-ND; Supplier 2: N.A.; Supplier Part Number 2: N.A.; Artikkelnr Noca: N.A.; Part number IPS: N.A.; Component Class: Switches; PartId: 101500004; Author: rsk; Part number Norautron: N.A.
SW7 = DIP-SW5-SPST: SWITCH SLIDE DIP SPST 25MA 24V; Manufacturer: Wurth Elektronik; Manufacturer Part Number: 416131160805; Note: N.A.; Pad Count: 10; Part Number: DIP-SW5-SPST; ComponentLink1URL: https://www.we-online.de/katalog/datasheet/4161311608xx.pdf; ComponentLink1Description: Datasheet; ComponentLink2Description: Supplier link; HelpURL: https://www.digikey.com/products/en/switches/dip-switches/194?k=&pkeyword=&sv=0&pv89=7036&sf=1&FV=ii5%7C2245%2C-8%7C194&quantity=&ColumnSort=252&page=1&stock=1&pageSize=25; Footprint Doc: SOIC127P840X265-10N; LatestRevisionDate: 2020-01-07; Publisher: Nordic Semiconductor; Published: 2020-01-07; Value: DIP-SW-5; Supplier 1: Digi-Key; Supplier Part Number 1: 732-3855-1-ND; Supplier 2: N.A.; Supplier Part Number 2: N.A.; Artikkelnr Noca: N.A.; Part number IPS: N.A.; Component Class: Switches; PartId: 101500125; ComponentLink2URL: N.A.; Author: rsk; Part number Norautron: N.A.
TP17 TP19 = TP_SMD_Ø1.5MM: 1.5mm circular SMD testpad; Manufacturer: Nordic Semiconductor; Manufacturer Part Number: N.A.; Pad Count: 1; Part Number: TP_SMD_Ø1.5MM; LatestRevisionDate: 2021-03-05; Published: 2016-06-02; Value: Ø1.5mm,SMD; Note: N.A.; Artikkelnr Noca: N.A.; Footprint Doc: TP_SMD_Ø1.5mm; Part number IPS: N.A.; ComponentLink1URL: N.A.; ComponentLink1Description: Datasheet; ComponentLink2URL: N.A.; ComponentLink2Description: Supplier link; HelpURL: N.A.; Supplier 1: N.A.; Supplier Part Number 1: N.A.; Supplier 2: N.A.; Supplier Part Number 2: N.A.; Component Class: Connectors; PartId: 100500477; Author: rsk; Part number Norautron: N.A.